# Altium schematic sheet Power_Driver.SchDoc
size A3; CheckedBy: Franci Lahajnar; DrawnBy: Ciril Močnik; DocumentNumber: 5; SheetNumber: 5; SheetTotal: 12; PageSetup: Record=PageOptions|CenterHorizontal=True|CenterVertical=True|PrintScale=0.96|XCorrection=1.00|YCorrection=1.00|PrintKind=0|BorderSize=5000000|LeftOffset=0|BottomOffset=0|Orientation=2|PaperLength=1000|PaperWidth=1000|Scale=100|PaperSource=7|PrintQuality=600|MediaType=1|DitherType=10|PaperKind=A4 210 x 297 mm|PrintScaleMode=1; Sklop: POWER DRIVER; TipDok: SCHEMATIC
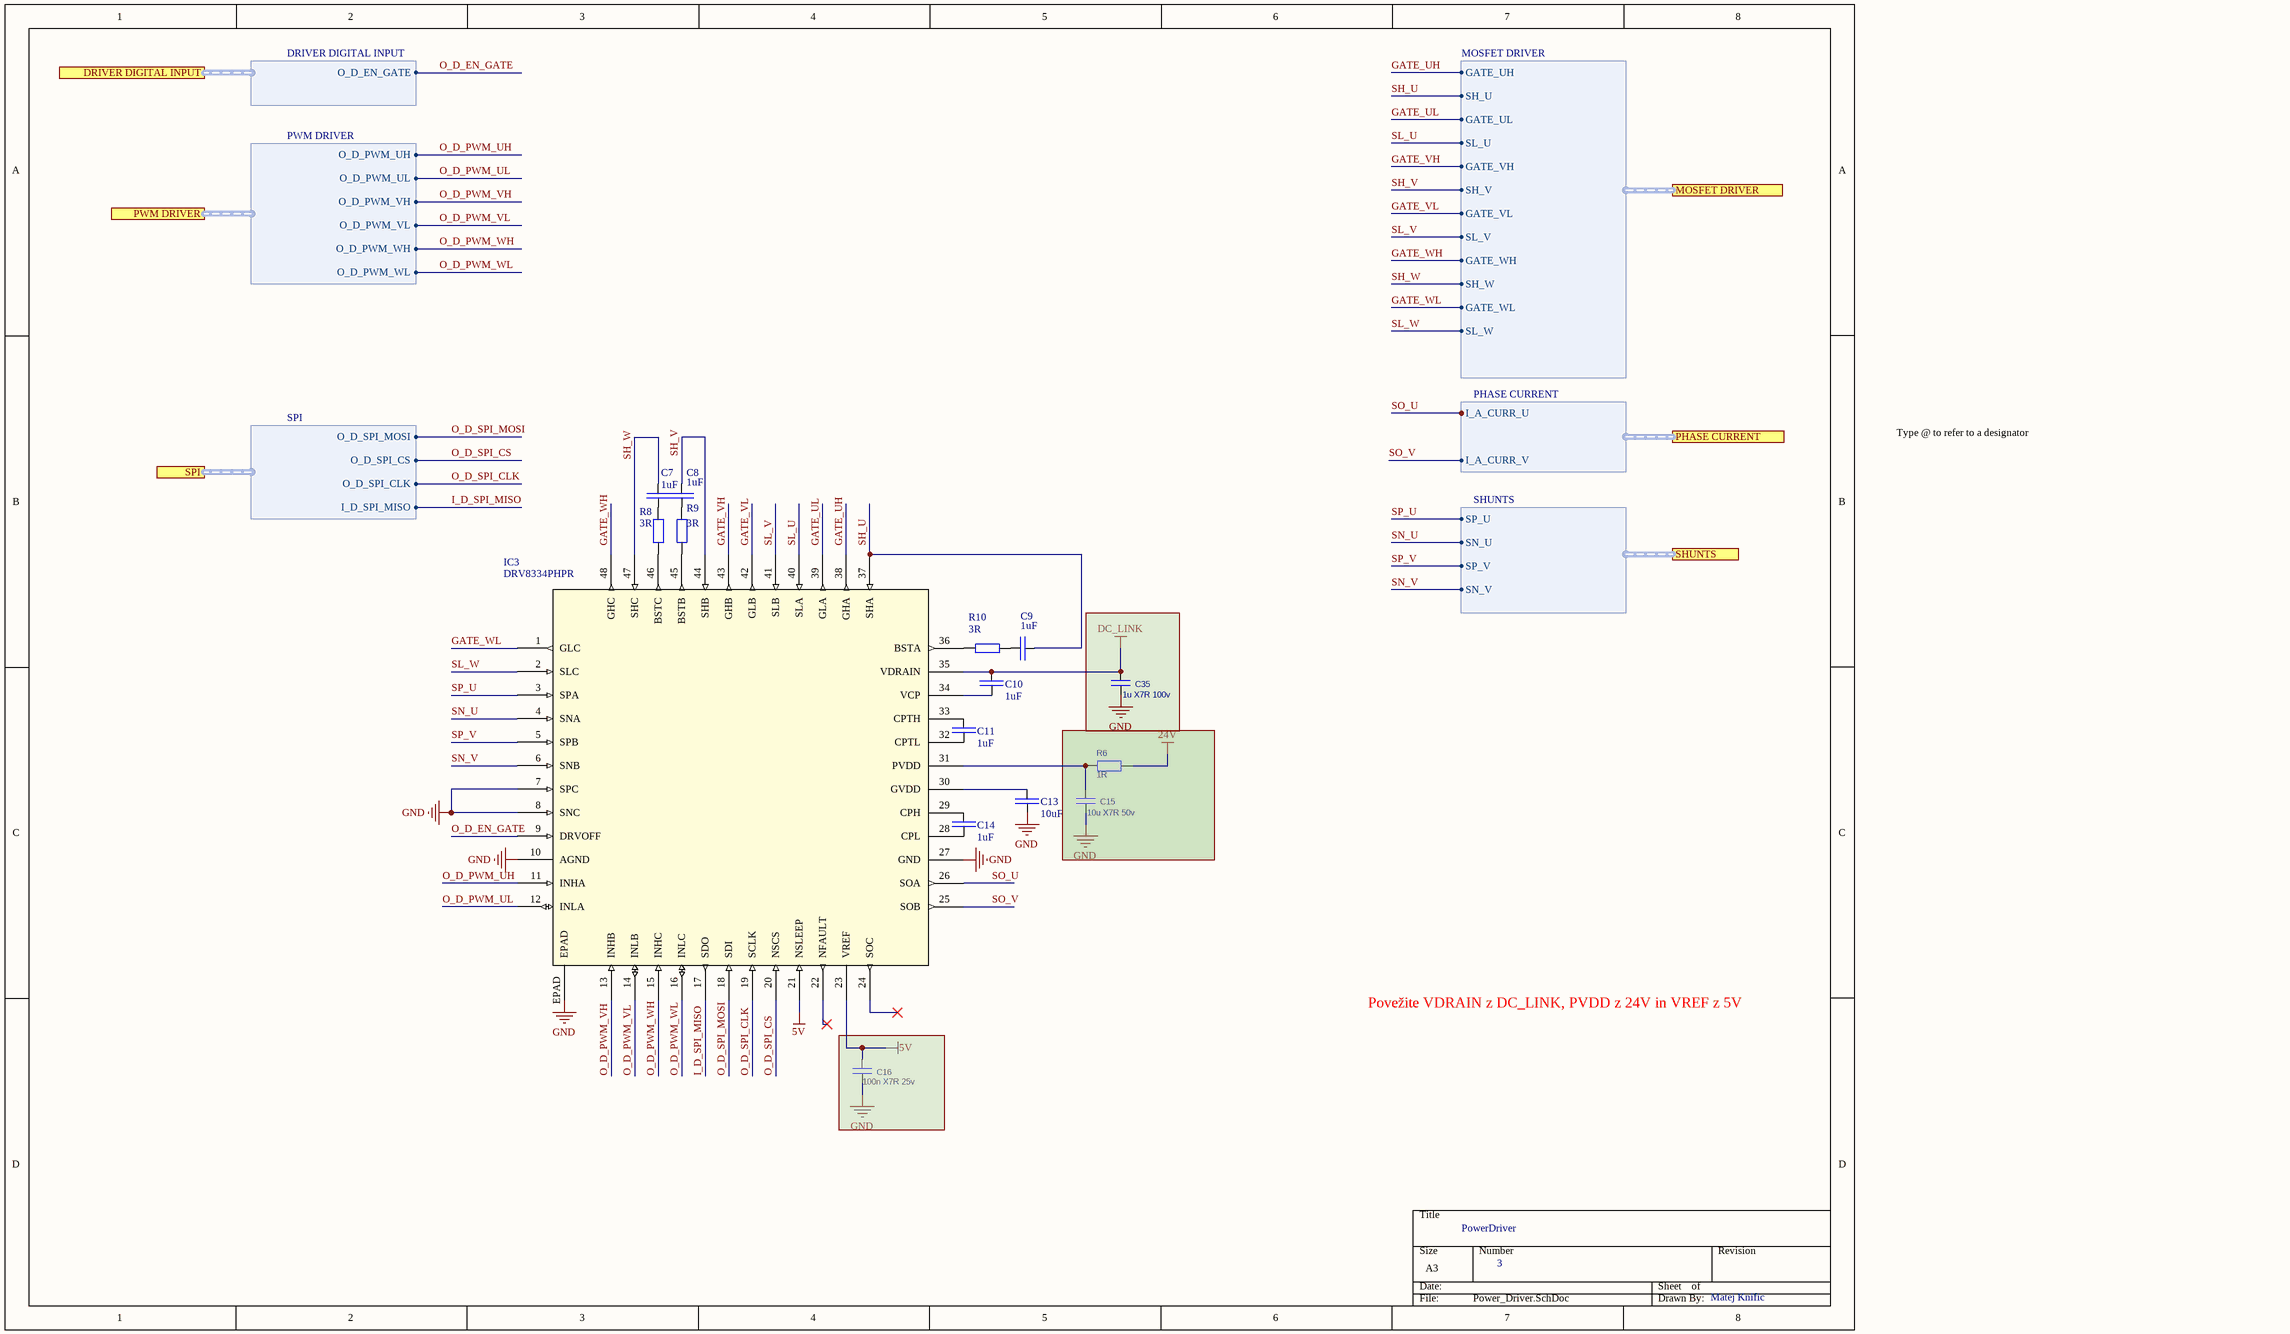
[diagram p0: Power_Driver.SchDoc]

## Parts
C7  HRVal: 1uF  [FPR_0805_C_R0_1]  (hidden comment: C_S_0805_1u_X7R_5)
C8  HRVal: 1uF  [FPR_0805_C_R0_1]  (hidden comment: C_S_0805_1u_X7R_5)
C9  HRVal: 1uF  [FPR_0805_C_R0_1]  (hidden comment: C_S_0805_1u_X7R_5)
C10  HRVal: 1uF  [FPR_0805_C_R0_1]  (hidden comment: C_S_0805_1u_X7R_5)
C11  HRVal: 1uF  [FPR_0805_C_R0_1]  (hidden comment: C_S_0805_1u_X7R_5)
C13  HRVal: 10uF  [FPR_1210_C_R0_10u]  (hidden comment: C_S_1210_10u_X7R_6)
C14  HRVal: 1uF  [FPR_0805_C_R0_1]  (hidden comment: C_S_0805_1u_X7R_5)
C15  10u X7R 50v  [RCL1210]
C16  100n X7R 25v  [C0603]
C35  1u X7R 100v  [RCL1210]
IC3  Manufacturer code: DRV8334PHPR  [FPR_HTQFP_48P]  (hidden comment: IC_D_DRV8334PHPR)
R6  1R  [R0603]
R8  HRVal: 3R  [FPR_0603_R_R0_1]  (hidden comment: R_L_0603_3R_1%_1)
R9  HRVal: 3R  [FPR_0603_R_R0_1]  (hidden comment: R_L_0603_3R_1%_1)
R10  HRVal: 3R  [FPR_0603_R_R0_1]  (hidden comment: R_L_0603_3R_1%_1)

## Ports
DRIVER DIGITAL INPUT (harness DRIVER DIGITAL INPUT), MOSFET DRIVER (harness MOSFET DRIVER), PHASE CURRENT (harness PHASE CURRENT), PWM DRIVER (harness PWM DRIVER), SHUNTS (harness SHUNTS), SPI (harness SPI)

## Harnesses
DRIVER DIGITAL INPUT: O_D_EN_GATE
PWM DRIVER: O_D_PWM_UH, O_D_PWM_UL, O_D_PWM_VH, O_D_PWM_VL, O_D_PWM_WH, O_D_PWM_WL
SPI: I_D_SPI_MISO, O_D_SPI_CLK, O_D_SPI_CS, O_D_SPI_MOSI
MOSFET DRIVER: GATE_UH, GATE_UL, GATE_VH, GATE_VL, GATE_WH, GATE_WL, SH_U, SH_V, SH_W, SL_U, SL_V, SL_W
PHASE CURRENT: I_A_CURR_U, I_A_CURR_V
SHUNTS: SP_U, SN_U, SP_V, SN_V

## Nets
5V: C16.1 IC3.21(NSLEEP) IC3.23(VREF)
24V: R6.1
DC_LINK: C10.1 C35.1 IC3.35(VDRAIN)
GND: C13.1 C15.2 C16.2 C35.2 IC3.7(SPC) IC3.8(SNC) IC3.10(AGND) IC3.27(GND) IC3.EPAD
GATE_UH: IC3.38(GHA) ; port MOSFET DRIVER.GATE_UH
GATE_UL: IC3.39(GLA) ; port MOSFET DRIVER.GATE_UL
GATE_VH: IC3.43(GHB) ; port MOSFET DRIVER.GATE_VH
GATE_VL: IC3.42(GLB) ; port MOSFET DRIVER.GATE_VL
GATE_WH: IC3.48(GHC) ; port MOSFET DRIVER.GATE_WH
GATE_WL: IC3.1(GLC) ; port MOSFET DRIVER.GATE_WL
I_D_SPI_MISO: IC3.17(SDO) ; port SPI.I_D_SPI_MISO
O_D_EN_GATE: IC3.9(DRVOFF) ; port DRIVER DIGITAL INPUT.O_D_EN_GATE
O_D_PWM_UH: IC3.11(INHA) ; port PWM DRIVER.O_D_PWM_UH
O_D_PWM_UL: IC3.12(INLA) ; port PWM DRIVER.O_D_PWM_UL
O_D_PWM_VH: IC3.13(INHB) ; port PWM DRIVER.O_D_PWM_VH
O_D_PWM_VL: IC3.14(INLB) ; port PWM DRIVER.O_D_PWM_VL
O_D_PWM_WH: IC3.15(INHC) ; port PWM DRIVER.O_D_PWM_WH
O_D_PWM_WL: IC3.16(INLC) ; port PWM DRIVER.O_D_PWM_WL
O_D_SPI_CLK: IC3.19(SCLK) ; port SPI.O_D_SPI_CLK
O_D_SPI_CS: IC3.20(NSCS) ; port SPI.O_D_SPI_CS
O_D_SPI_MOSI: IC3.18(SDI) ; port SPI.O_D_SPI_MOSI
SH_U: C9.2 IC3.37(SHA) ; port MOSFET DRIVER.SH_U
SH_V: C8.2 IC3.44(SHB) ; port MOSFET DRIVER.SH_V
SH_W: C7.2 IC3.47(SHC) ; port MOSFET DRIVER.SH_W
SL_U: IC3.40(SLA) ; port MOSFET DRIVER.SL_U
SL_V: IC3.41(SLB) ; port MOSFET DRIVER.SL_V
SL_W: IC3.2(SLC) ; port MOSFET DRIVER.SL_W
SN_U: IC3.4(SNA) ; port SHUNTS.SN_U
SN_V: IC3.6(SNB) ; port SHUNTS.SN_V
SO_U: IC3.26(SOA) ; port PHASE CURRENT.I_A_CURR_U
SO_V: IC3.25(SOB) ; port PHASE CURRENT.I_A_CURR_V
SP_U: IC3.3(SPA) ; port SHUNTS.SP_U
SP_V: IC3.5(SPB) ; port SHUNTS.SP_V
NetC7_1: C7.1 R8.2
NetC8_1: C8.1 R9.2
NetC9_1: C9.1 R10.2
NetC10_2: C10.2 IC3.34(VCP)
NetC11_1: C11.1 IC3.33(CPTH)
NetC11_2: C11.2 IC3.32(CPTL)
NetC13_2: C13.2 IC3.30(GVDD)
NetC14_1: C14.1 IC3.29(CPH)
NetC14_2: C14.2 IC3.28(CPL)
NetC15_1: C15.1 IC3.31(PVDD) R6.2
NetIC3_36: IC3.36(BSTA) R10.1
NetIC3_45: IC3.45(BSTB) R9.1
NetIC3_46: IC3.46(BSTC) R8.1

Not connected (* = marked no-connect by the designer): IC3 22(NFAULT)* 24(SOC)*

## Notes on the sheet
- Type @ to refer to a designator
- Povežite VDRAIN z DC_LINK, PVDD z 24V in VREF z 5V
- PowerDriver
- 3
- Matej Knific
- Kolektor Group d.o.o.
- KOLEKTOR
- GROUP
- Datum:
- Konst.:
- Naziv
- Sklop
- ECN
- SAP ID
- Rev.:
- List:
- Vojkova 10, p.p. 85
- SI-5280 Idrija , Slovenija
- Koda
- Datoteka:

## Library data of the parts
C7-C11 C14 = C_S_0805_1u_X7R_5-3: Single capacitor 1uF 10% soft-term AEC200; Manufacturer: Murata; Manufacturer code: GCJ21BR71H105KA01L; SAP Name: KONDENZATOR GCJ21BR71H105KA01L MUR; BS: BS1556; Tolerance: 10; Value [F]: 1e-6; Voltage: 50; SAP Ident: 927197; Class: 15562; Mount: SMD; ROHS: 2011/65/EU; Datasheet: https://www.murata.com/~/media/webrenewal/support/library/catalog/products/capacitor/mlcc/c03e.ashx; TemperatureGrade: -55...125; Housing: 0805; AEC: 21.8.2019; REACH: 20.6.2016; UL: -; MSL: 1
C13 = C_S_1210_10u_X7R_6-4: Single capacitor 10uF; Manufacturer: AVX; Manufacturer code: 12105C106K4Z4A; BS: BS1556; SAP Name: KONDENZATOR 12105C106K4Z4A AVX; Tolerance: 10; Value [F]: 10e-6; Voltage: 50; SAP Ident: 919177; Class: 15562; Shelf life: 12 months; ROHS: 2011/65/EU; AEC: 3.6.2019; TemperatureGrade: -55...125; MSL: /; UL: -; Housing: 1210; Datasheet: /; Mount: SMD; REACH: 15.1.2019
C15 C16 C35 = C: Capacitor
  C15: Value: 10u X7R 50v
  C16: Value: 100n X7R 25v
  C35: Value: 1u X7R 100v
IC3 = IC_D_DRV8334PHPR-3: Three phase MOSFET driver; Manufacturer: TI; AEC: No; BS: BS1557; Class: 15571; Output Current: 1000 / 2000 mA; Output Voltage: 60; SAP Ident: 1125019; SAP Name: GONILNIK DRV8334PHPR TI; Datasheet: /; Housing: HTQFP; HRVal: DRV8334PHPR; Mount: SMD; REACH: 23.07.2024; ROHS: 2011/65/EU; TemperatureGrade: -40...125; UL: -; MSL: 1
R6 = R: Value: 1R
R8-R10 = R_L_0603_3R_1%_1-3: Upor 3R 0603 1% 100mW; Manufacturer code: CRCW06033R00FKEA; Manufacturer: VISHAY; SAP Name: UPOR CRCW06033R00FKEA VIS; Tolerance: 1; Power: 100e-3; ReleaseDateNum: 45455.4806185648; BS: BS1556; Class: 15561; Value [Ohm]: 3; SAP Ident: 1125027; Housing: 0603; TemperatureGrade: -55...155; Mount: SMD; ROHS: 2015/863/EU; Datasheet: https://www.vishay.com/docs/20035/dcrcwe3.pdf; AEC: 11.6.2024; REACH: 23.1.2024; UL: 1; MSL: 1